# Altium schematic sheet signal-light-9.SchDoc
size A4; SheetNumber: 12; SheetTotal: 21
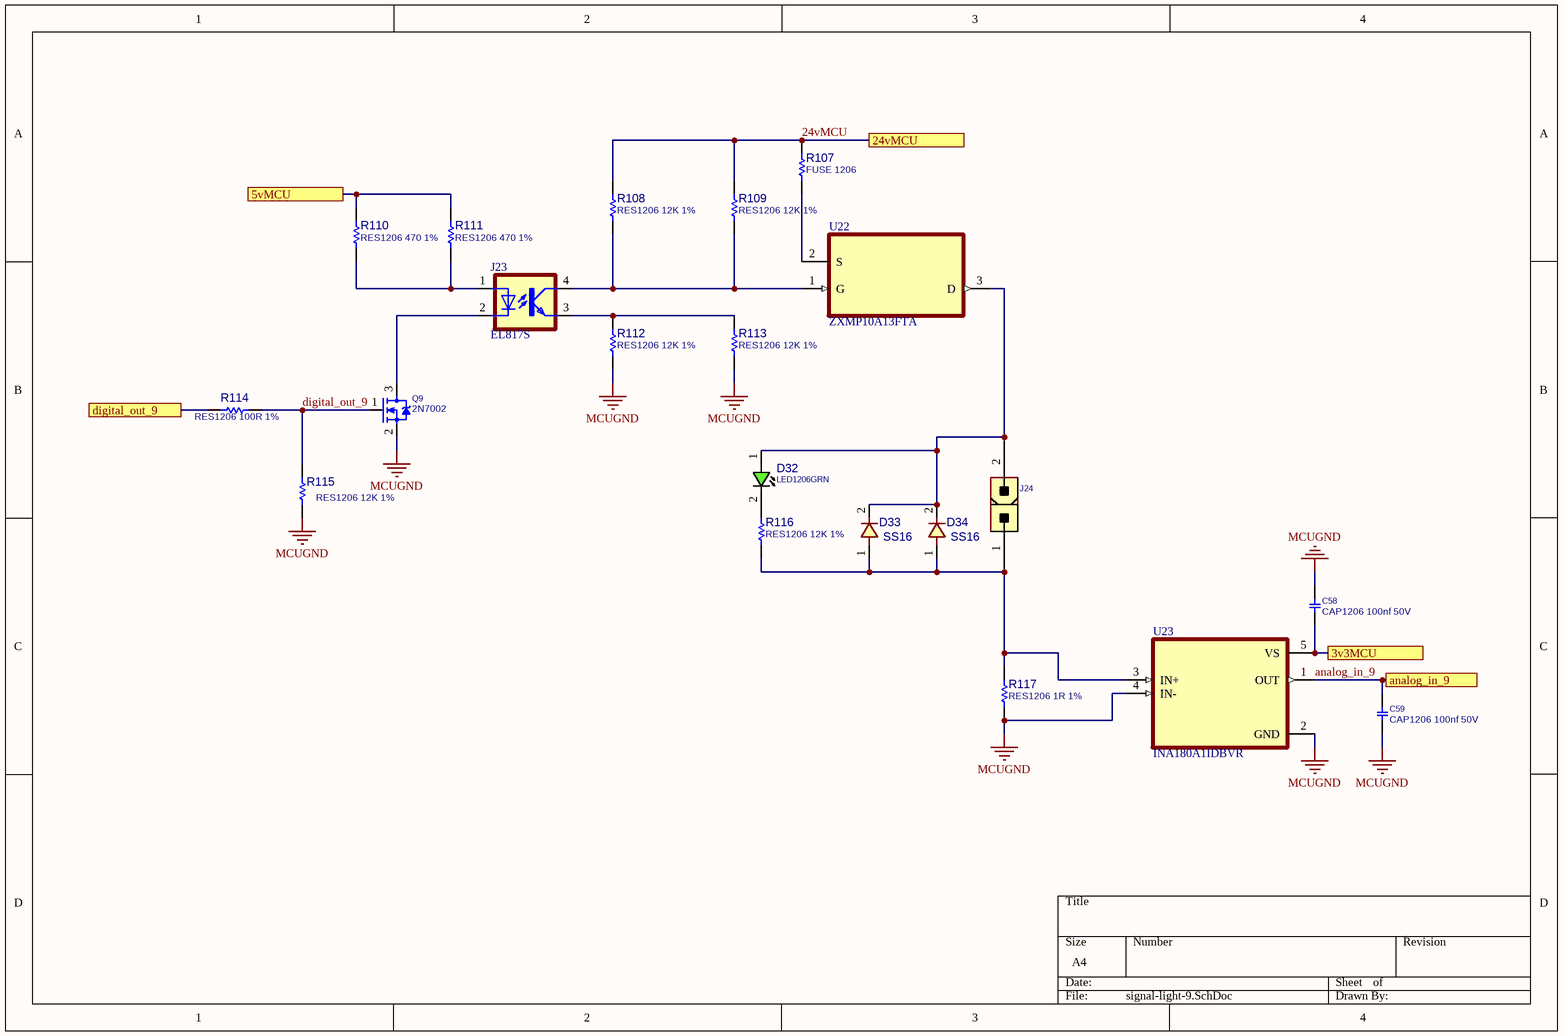
[diagram p0: signal-light-9.SchDoc]

## Parts
C58  CAP1206 100nf 50V  [C1206]
C59  CAP1206 100nf 50V  [C1206]
D32  LED1206GRN  [LED1206GRN]
D33  SS16  [D_SMA]
D34  SS16  [D_SMA]
J23  EL817S  [SOIC254P1030X460-4N]
J24  CONN_ATXPWR_2  [ATXPWR_2]  (value not drawn)
Q9  2N7002  [SOT23_3]
R107  FUSE 1206  [R1206]
R108  RES1206 12K 1%  [R1206]
R109  RES1206 12K 1%  [R1206]
R110  RES1206 470 1%  [R1206]
R111  RES1206 470 1%  [R1206]
R112  RES1206 12K 1%  [R1206]
R113  RES1206 12K 1%  [R1206]
R114  RES1206 100R 1%  [R1206]
R115  RES1206 12K 1%  [R1206]
R116  RES1206 12K 1%  [R1206]
R117  RES1206 1R 1%  [R1206]
U22  ZXMP10A13FTA  [SOT95P230X110-3N]
U23  INA180A1IDBVR  [SOT95P280X145-5N]

## Ports
3v3MCU, 5vMCU, 24vMCU, analog_in_9, digital_out_9

## Nets
MCUGND: C58.1 C59.2 Q9.2(SOURCE) R112.2 R113.2 R115.2 R117.2 U23.2(GND) U23.4(IN-)
3v3MCU: C58.2 U23.5(VS) ; port 3v3MCU
5vMCU: R110.2 R111.2 ; port 5vMCU
24vMCU: R107.1 R108.1 R109.1 ; port 24vMCU
analog_in_9: C59.1 U23.1(OUT) ; port analog_in_9
digital_out_9: Q9.1(GATE) R114.2 R115.1
digital_out_9: R114.1 ; port digital_out_9  [a separate net that carries the same name]
NetD32_1: D32.1(ANODE) D33.2 D34.2 J24.2 U22.3(D)
NetD32_2: D32.2(CATHODE) R116.1
NetD33_1: D33.1 D34.1 J24.1 R116.2 R117.1 U23.3(IN+)
NetJ23_1: J23.1(A) R110.1 R111.1
NetJ23_2: J23.2(C) Q9.3(DRAIN)
NetJ23_3: J23.3(EMIT) R112.1 R113.1
NetJ23_4: J23.4(COL) R108.2 R109.2 U22.1(G)
NetR107_2: R107.2 U22.2(S)

## Library data of the parts
C58 C59 = CAP_SMD_MLCC_1206: CAP, MLCC; PARAM: -, -%; MANF_P#: MANF_PART#; PARAM2: -V; PRICE: 100= 1$; MANF: -; ASSEMBLY: ASSEMBLY
D32 = LED_SMD_1206_GRN: LED, SMD, 1206, GREEN; PARAM: 20mA; DESC: DESCRIPTION; PARAM2: 2.2V; MANF: -; ASSEMBLY: ASSEMBLY; PRICE: 36t@Javan; MANF_P#: -; VALUE: LED1206GRN; MountType: SMT; PartType: LED
D33 D34 = DIODE_SMD_1N4001: DIODE, GENERAL PURPOSE, 50V/1A; DESC: DESCRIPTION; PARAM: 50V VRRM; PARAM2: 1A; MANF_P#: 1N4001; MANF: MANF; ASSEMBLY: ASSEMBLY; PRICE: PRICE; VALUE: SS16
J23 = EL817S: Optoisolator Transistor Output 5000Vrms 1 Channel 4-SMD; MF: Everlight Electronics; SnapEDA_Link: https://www.snapeda.com/parts/EL817S/Everlight+Electronics+Co+Ltd/view-part/?ref=snap; Package: SMD-4 Everlight Electronics Co Ltd; Value: *; MP: EL817S; Check_prices: https://www.snapeda.com/parts/EL817S/Everlight+Electronics+Co+Ltd/view-part/?ref=eda
J24 = CONN_ATXPWR_2: CONN, ATX POWER, 2 P; MANF: Molex; MANF_P#: 39281023; VALUE: CONN_ATXPWR_2; MountType: THD; PACKAGE: ATXPWR-2pin; Part Type: Conn.
Q9 = MOSN_2N7002_SOT23: MOSFET, N-CH, 60V, 0.3A; MANF: NXP; ASSEMBLY: ASSEMBLY; MANF_P#: 2N7002; PARAM2: 60v; PARAM: 0.3A; PRICE: 0.3t@Javan; VALUE: 2N7002
R107-R117 = RES_SMD_1206: RESISTOR, SMD; PARAM: 1%, 0.25W; DESC: DESCRIPTION; DIST#: MOUSER; MANF_P#: -; MANF: -; ASSEMBLY: ASSEMBLY; PRICE: -; PARAM2: -
U22 = ZXMP10A13FTA: P-Channel 100 V 600mA (Ta) 625mW (Ta) Surface Mount SOT-23-3; MF: Diodes Inc.; Purchase-URL: https://pricing.snapeda.com/search/part/ZXMP10A13FTA/?ref=eda; Package: SOT-23-3 Diodes Inc.; SnapEDA_Link: https://www.snapeda.com/parts/ZXMP10A13FTA/Diodes+Inc./view-part/?ref=snap; Availability: In Stock; Value: *; MP: ZXMP10A13FTA; Check_prices: https://www.snapeda.com/parts/ZXMP10A13FTA/Diodes+Inc./view-part/?ref=eda; Price: None
U23 = INA180A1IDBVR: 26V, 350kHz current sense amplifier; MF: Texas Instruments; SnapEDA_Link: https://www.snapeda.com/parts/INA180A1IDBVR/Texas+Instruments/view-part/?ref=snap; Package: SOT-23-5 Texas Instruments; Value: *; MP: INA180A1IDBVR; Check_prices: https://www.snapeda.com/parts/INA180A1IDBVR/Texas+Instruments/view-part/?ref=eda